# Altium schematic sheet C22367839_SCH.SchDoc
size 127 x 101 mm
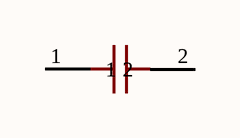
[diagram p0: C22367839_SCH.SchDoc]

## Parts
C??  HHV1206R7475K101NSPJ  (value not drawn)

## Nets

Not connected (* = marked no-connect by the designer): C?? 1 2

## Library data of the parts
C?? = HHV1206R7475K101NSPJ: ??:10uF;??:-20%~+80%;????:10V;????:Y5V;